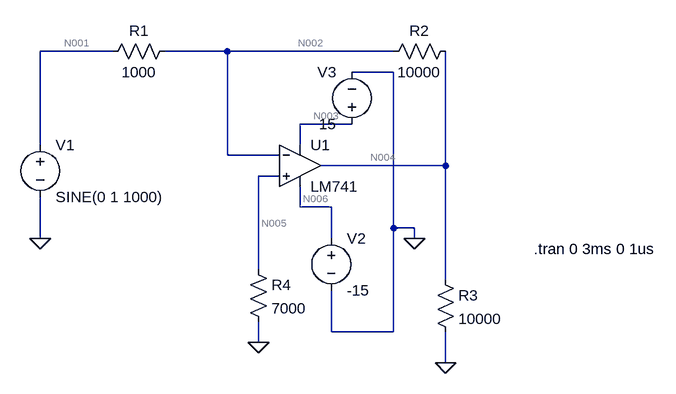
[diagram p0: schematic Draft2.asc]
Draft2.asc, the LTspice schematic file:
Version 4.1
SHEET 1 964 680
WIRE 112 -320 0 -320
WIRE 288 -320 192 -320
WIRE 544 -320 288 -320
WIRE 544 -288 480 -288
WIRE 480 -208 400 -208
WIRE 0 -176 0 -320
WIRE 400 -176 400 -208
WIRE 288 -160 288 -320
WIRE 368 -160 288 -160
WIRE 624 -144 624 -320
WIRE 624 -144 432 -144
WIRE 368 -128 336 -128
WIRE 400 -80 400 -112
WIRE 448 -80 400 -80
WIRE 544 -48 544 -288
WIRE 576 -48 544 -48
WIRE 0 -32 0 -96
WIRE 448 -32 448 -80
WIRE 576 -32 576 -48
WIRE 336 16 336 -128
WIRE 624 32 624 -144
WIRE 448 112 448 48
WIRE 544 112 544 -48
WIRE 544 112 448 112
WIRE 336 128 336 96
WIRE 624 160 624 112
FLAG 0 -32 0
FLAG 336 128 0
FLAG 624 160 0
FLAG 576 -32 0
SYMBOL voltage 0 -192 R0
WINDOW 123 0 0 Left 0
WINDOW 39 0 0 Left 0
SYMATTR InstName V1
SYMATTR Value SINE(0 1 1000)
SYMBOL res 208 -336 R90
WINDOW 0 0 56 VBottom 2
WINDOW 3 32 56 VTop 2
SYMATTR InstName R1
SYMATTR Value 1000
SYMBOL res 640 -336 R90
WINDOW 0 0 56 VBottom 2
WINDOW 3 32 56 VTop 2
SYMATTR InstName R2
SYMATTR Value 10000
SYMBOL res 608 16 R0
SYMATTR InstName R3
SYMATTR Value 10000
SYMBOL res 320 0 R0
SYMATTR InstName R4
SYMATTR Value 7000
SYMBOL LM741 400 -208 R0
SYMATTR InstName U1
SYMBOL voltage 448 -48 R0
WINDOW 123 0 0 Left 0
WINDOW 39 0 0 Left 0
SYMATTR InstName V2
SYMATTR Value -15
SYMBOL voltage 480 -192 R180
WINDOW 0 24 96 Left 2
WINDOW 3 24 16 Left 2
WINDOW 123 0 0 Left 0
WINDOW 39 0 0 Left 0
SYMATTR InstName V3
SYMATTR Value 15
TEXT 760 -16 Left 2 !.tran 0 3ms 0 1us

The netlist it stands for:
* Draft2.asc
V1 N001 0 SINE(0 1 1000)
R1 N002 N001 1000
R2 N004 N002 10000
R3 N004 0 10000
R4 N005 0 7000
X§U1 N005 N002 N003 N006 N004 LM741  ; pins In+ In- V+ V- OUT
V2 N006 0 -15
V3 N003 0 15
.tran 0 3ms 0 1us
.lib LM741.lib
.backanno
.end

* Results of the author's LTspice run, read from the files saved beside the schematic
* Operating Point, zero values left out:
*   V(n002) = 595 µV
*   V(n003) = 15 V
*   V(n004) = 7.563 mV
*   V(n005) = -405 µV
*   V(n006) = -15 V
*   I(R1) = 595 nA
*   I(R2) = 696.8 nA
*   I(R3) = 756.3 nA
*   I(R4) = -57.86 nA
*   I(V1) = 595 nA
*   I(V2) = 1.7 mA
*   I(V3) = -1.702 mA
*   Ix(u1:1) = 57.86 nA
*   Ix(u1:2) = 101.9 nA
*   Ix(u1:28) = -1.453 µA
*   Ix(u1:50) = -1.7 mA
*   Ix(u1:99) = 1.702 mA
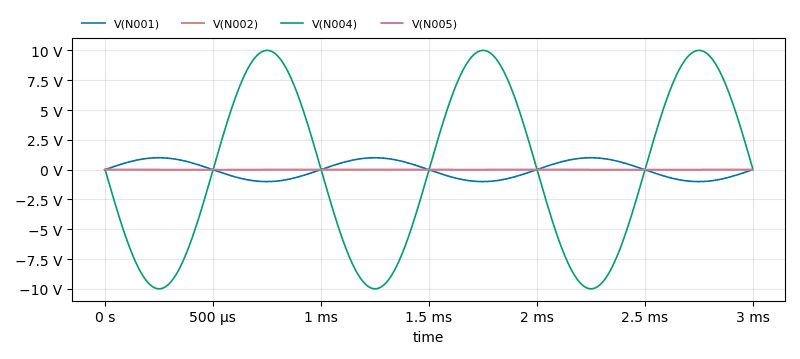
[diagram p1: Transient Analysis of Draft2.asc, plotted from the saved traces]
* Transient Analysis, 1 run:
*   V(N001): min -1 V, max 1 V, average 0 V, rms 707.1 mV, last 0 V
*   V(N002): min -10.16 mV, max 11.35 mV, average 588.4 µV, rms 7.436 mV, last 11.34 mV
*   V(N004): min -9.991 V, max 10.01 V, average 7.491 mV, rms 7.07 V, last 126.1 mV
*   V(N005): min -663.9 µV, max -146.1 µV, average -405.2 µV, rms 442.8 µV, last -146.4 µV